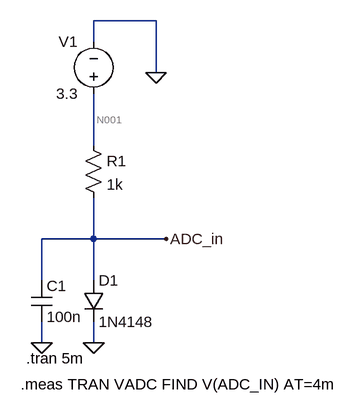
[diagram p0: schematic Draft1.asc]
Draft1.asc, the LTspice schematic file:
Version 4
SHEET 1 880 680
WIRE 304 80 208 80
WIRE 208 112 208 80
WIRE 304 160 304 80
WIRE 208 272 208 192
WIRE 208 416 208 352
WIRE 208 416 128 416
WIRE 320 416 208 416
WIRE 128 480 128 416
WIRE 208 480 208 416
WIRE 128 576 128 544
WIRE 208 576 208 544
FLAG 128 576 0
FLAG 208 576 0
FLAG 320 416 ADC_in
FLAG 304 160 0
SYMBOL voltage 208 208 R180
WINDOW 0 24 96 Left 2
WINDOW 3 24 16 Left 2
WINDOW 123 0 0 Left 0
WINDOW 39 0 0 Left 0
SYMATTR InstName V1
SYMATTR Value 3.3
SYMBOL res 192 256 R0
SYMATTR InstName R1
SYMATTR Value 1k
SYMBOL cap 112 480 R0
SYMATTR InstName C1
SYMATTR Value 100n
SYMBOL diode 192 480 R0
SYMATTR InstName D1
SYMATTR Value 1N4148
TEXT 104 600 Left 2 !.tran 5m
TEXT 96 640 Left 2 !.meas TRAN VADC FIND V(ADC_IN) AT=4m

The netlist it stands for:
* Draft1.asc
V1 N001 0 3.3
R1 N001 ADC_in 1k
C1 ADC_in 0 100n
D1 ADC_in 0 1N4148
.model D D
.lib standard.dio
.tran 5m
.meas TRAN VADC FIND V(ADC_IN) AT=4m
.backanno
.end

* Results of the author's LTspice run, read from the files saved beside the schematic
* Operating Point, zero values left out:
*   V(n001) = 3.3 V
*   V(adc_in) = 630.2 mV
*   I(D1) = 2.67 mA
*   I(R1) = 2.67 mA
*   I(V1) = -2.67 mA
* From the log:
*   vadc: v(adc_in)=0.630189 at 0.004